# Altium schematic sheet Encoder-Sheet.SchDoc
size A4; SheetNumber: 4; SheetTotal: 5
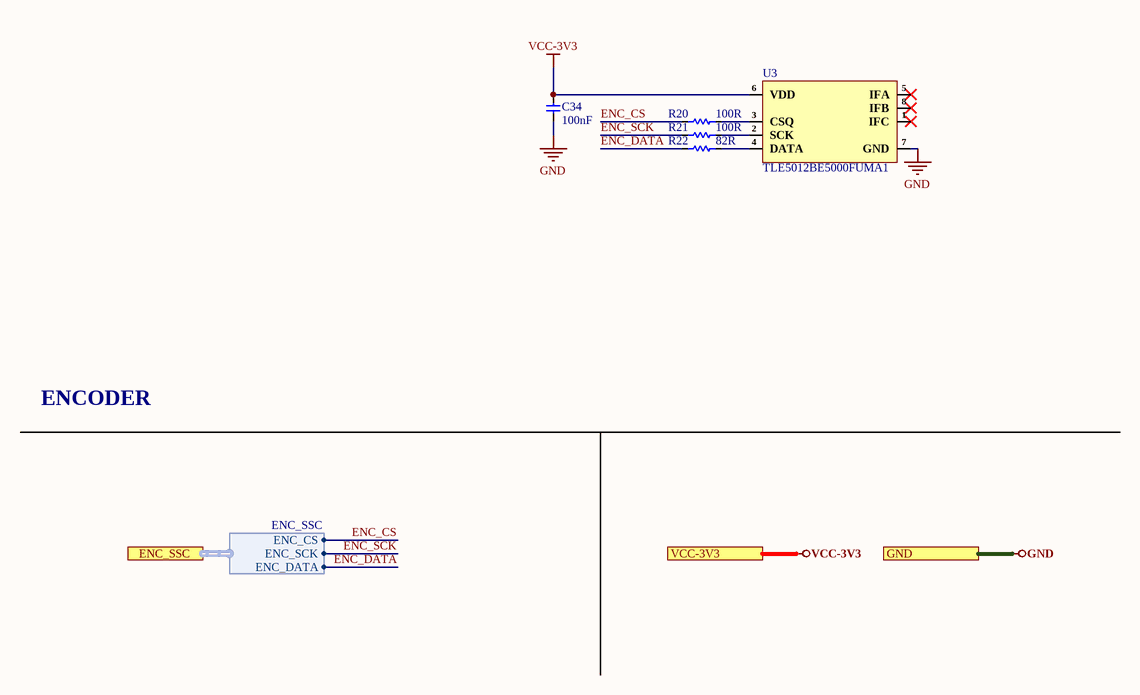
[diagram p0: Encoder-Sheet.SchDoc]

## Parts
C34  100nF  [CAP-0201]
R20  100R  [Res-0201]
R21  100R  [Res-0201]
R22  82R  [Res-0201]
U3  TLE5012BE5000FUMA1  [TLE5012BE5000FUMA1]

## Ports
ENC_SSC (harness ENC_SSC, see Top-Sheet[2C], Controller-Sheet-2[1D]), GND (see Top-Sheet[1C], Connector-Sheet[3D], Controller-Sheet-1[2D], Controller-Sheet-2[3D]), VCC-3V3 (see Top-Sheet[1C], Connector-Sheet[3D], Controller-Sheet-1[2D], Controller-Sheet-2[3D])

## Harnesses
ENC_SSC: ENC_CS, ENC_SCK, ENC_DATA

## Nets
GND: C34.1 U3.7(GND) ; port GND
VCC-3V3: C34.2 U3.6(VDD) ; port VCC-3V3
ENC_CS: R20.1 ; port ENC_SSC.ENC_CS
ENC_DATA: R22.1 ; port ENC_SSC.ENC_DATA
ENC_SCK: R21.1 ; port ENC_SSC.ENC_SCK
NetR20_2: R20.2 U3.3(CSQ)
NetR21_2: R21.2 U3.2(SCK)
NetR22_2: R22.2 U3.4(DATA)

Not connected (* = marked no-connect by the designer): U3 1(IFC)* 5(IFA)* 8(IFB)*

## Notes on the sheet
- ENCODER
- File:
- Title:
- Date:
- Page
- Num:
- Total:
- Drawn By: Huzaifa Ali

## Library data of the parts
C34 = CC0201KRX5R6BB104: CAP CER 0.1UF 10V X5R 0201; Manufacturer: Yageo; Tolerance: 10%; Supplier 1: Mouser; Manufacturer Part Number: CC0201KRX5R6BB104; RoHS: Yes; Category: Ceramic Capacitors; Stock 1: 824403; Pricing 1: 1=0.10000, 10=0.02400, 50=0.02400, 100=0.01900, 1000=0.01100, 10000=0.00900 (USD); Mount: Surface Mount; Case/Package: 0201; Case Code (Imperial): 0201; Case Code (Metric): 0603; Weight: 6E-06oz; Min Operating Temperature: -55°C; Max Operating Temperature: 85°C; Capacitance: 100nF; Dielectric: X5R; Voltage Rating (DC): 10V; Packaging: Tape and Reel; Termination: SMD/SMT; Resistor Type: Ceramic; Voltage Rating: 10V; Series: CC; Construction: Flat; Length: 0.6mm; Width: 0.012inch; Height: 0.3mm; Thickness: 0.013inch; Depth: 0.3mm; Radiation Hardening: No; Lead Free: Lead Free; Halogen Free: Halogen Free; RoHS Compliant: Yes; ComponentLink1URL: https://datasheet.ciiva.com/11587/upy-gphc-x5r-4v-to-50v-12-11587190.pdf?src-supplier=Avnet; ComponentLink1Description: https://datasheet.ciiva.com/11587/upy-gphc-x5r-4v-to-50v-12-11587190.pdf?src-supplier=Avnet; Supplier Part Number 1: 603-CC201KRX5R6BB104; LCSC Part Number: C190183
R20 R21 = RC0201FR-07100RL: RES 100 OHM Thick Film 0201 1% 1/20W ±200ppm/°C Molded SMD SMD Paper T/R; Manufacturer: Yageo; Power Rating: 50mW; Voltage Rating: 25V; Item Type: Resistor; Supplier: Digi-Key; Supplier Part Number: 311-100MCT-ND; Manufacturer Part Number: RC0201FR-07100RL; RoHS: Yes; Category: Chip SMD Resistors; Stock: 193246; Pricing: 1=0.1, 10=0.027, 50=0.0172, 100=0.0143, 500=0.00988, 1000=0.00854, 5000=0.00629 (USD); Case/Package: 0201; Contact Plating: Tin,Matte; Case Code (Metric): 0603; Package: 0201; Min Operating Temperature: -55°C; Max Operating Temperature: 125°C; Value: 100R; Tolerance: 1%; Resistor Type: Thick Film; Temperature Coefficient: 200ppm/°C; Packaging: Cut Tape; Package Quantity: 1; Number of Terminations: 2; Termination: SMD/SMT; Max Power Dissipation: 50mW; Features: Moisture Resistant; Series: RC; Resistance Tolerance: 1%; Length: 0.024inch; Width: 0.012inch; Height: 0.01inch; Lead Free: Lead Free; RoHS Compliant: Yes; Reach SVHC Compliant: Unknown; ComponentLink1URL: https://datasheet.ciiva.com/2560/pyu-r-int-thick-7-2560866.pdf?src-supplier=Digi-Key; ComponentLink1Description: https://datasheet.ciiva.com/2560/pyu-r-int-thick-7-2560866.pdf?src-supplier=Digi-Key; ComponentLink2URL: https://datasheet.ciiva.com/2560/pyu-r-int-thick-7-2560867.pdf?src-supplier=Digi-Key; ComponentLink2Description: https://datasheet.ciiva.com/2560/pyu-r-int-thick-7-2560867.pdf?src-supplier=Digi-Key; ComponentLink3URL: https://datasheet.ciiva.com/2560/pyu-r-int-thick-7-2560865.pdf?src-supplier=Digi-Key; ComponentLink3Description: https://datasheet.ciiva.com/2560/pyu-r-int-thick-7-2560865.pdf?src-supplier=Digi-Key; ComponentLink4URL: https://datasheet.ciiva.com/8887/pyu-rc0201-51-rohs-l-8-8887865.pdf?src-supplier=Avnet; ComponentLink4Description: https://datasheet.ciiva.com/8887/pyu-rc0201-51-rohs-l-8-8887865.pdf?src-supplier=Avnet; LCSC Part Number: C77623; ComponentLink5Description: LCSC; ComponentLink5URL: https://www.lcsc.com/product-detail/Chip-Resistor-Surface-Mount_YAGEO-RC0201FR-07100RL_C77623.html
R22 = RC0201FR-0782RL: RES 82 OHM 0201 Thick Film 1% 0.05W(1/20W) ±200ppm/C Pad SMD T/R; Manufacturer: Yageo; Power Rating: 50mW; Voltage Rating: 25V; Temperature Coefficient: 200ppm/°C; Item Type: Resistor; Supplier: Digi-Key; Supplier Part Number: YAG2818CT-ND; Manufacturer Part Number: RC0201FR-0782RL; RoHS: Yes; Category: Chip SMD Resistors; Stock: 59484; Pricing: 1=0.1, 10=0.027, 50=0.0172, 100=0.0143, 500=0.00988, 1000=0.00854, 5000=0.00629 (USD); Case/Package: 0201; Case Code (Imperial): 0201; Case Code (Metric): 0603; Min Operating Temperature: -55°C; Max Operating Temperature: 125°C; Tolerance: 1%; Value: 82R; Packaging: Tape and Reel; Resistor Type: Thick Film; Number of Terminations: 2; Termination: SMD/SMT; Max Power Dissipation: 50mW; Working Voltage: 25V; Features: Moisture Resistant; Series: RC; Resistance Tolerance: 1%; Technology: THICK FILM; Length: 0.6mm; Width: 0.3mm; Height: 0.23mm; Reach SVHC Compliant: No; Lead Free: Lead Free; RoHS Compliant: Yes; ComponentLink1URL: https://datasheet.ciiva.com/22661/1563626-22661339.pdf?src-supplier=Element14; ComponentLink1Description: https://datasheet.ciiva.com/22661/1563626-22661339.pdf?src-supplier=Element14; LCSC Part Number: C273281; ComponentLink2Description: LCSC; ComponentLink2URL: https://www.lcsc.com/product-detail/Chip-Resistor-Surface-Mount_YAGEO-RC0201FR-0782RL_C273281.html
U3 = TLE5012BE5000FUMA1: MAGNETIC ANGLE SENSOR; Manufacturer: Infineon; Interface: SPI,PWM; Supplier 1: RSComponents; Manufacturer Part Number: TLE5012BE5000; RoHS: Yes; Category: Magnetic Sensors; Number of Pins: 8; Series: TLE5012; Package Quantity: 2500; Packaging: Tape and Reel; RoHS Compliant: Yes; ComponentLink1URL: http://www.mouser.com/ds/2/196/Infineon-TLE5012B_Exxxx-DS-v02_00-en-540142.pdf?src-supplier=Mouser; ComponentLink1Description: http://www.mouser.com/ds/2/196/Infineon-TLE5012B_Exxxx-DS-v02_00-en-540142.pdf?src-supplier=Mouser; Supplier Part Number 1: 2238590